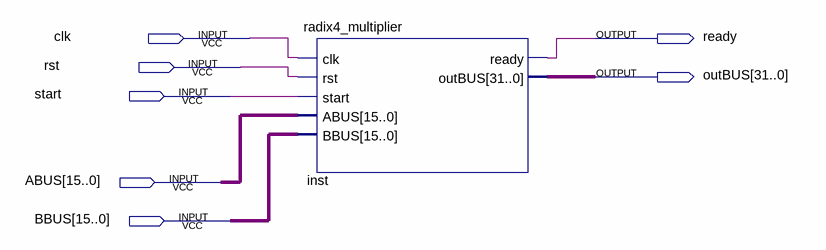
[diagram p0: schematic sheet]
// Quartus schematic radix4_multiplier_schematic.bdf as structural Verilog: 1 symbols, 7 pins
module radix4_multiplier_schematic (
  input  clk,
  input  rst,
  input  start,
  input  [15:0] ABUS,
  input  [15:0] BBUS,
  output ready,
  output [31:0] outBUS
);

  radix4_multiplier inst (
    .clk(clk), .rst(rst), .start(start), .ABUS(ABUS), .BBUS(BBUS), .ready(ready), .outBUS(outBUS));
endmodule
